# Altium schematic sheet JTAG_Product_Programmer_Interface.SchDoc
size A; Author: Jared Ainsworth; CompanyName: UpRev LLC; Engineer: Jared Ainsworth; Organization: UpRev LLC; Address1: 4807 Commercial Park Dr.; Address2: Austin, TX 78724; Address3: United States; Address4: www.UpRev.com; SheetNumber: 8; SheetTotal: 13
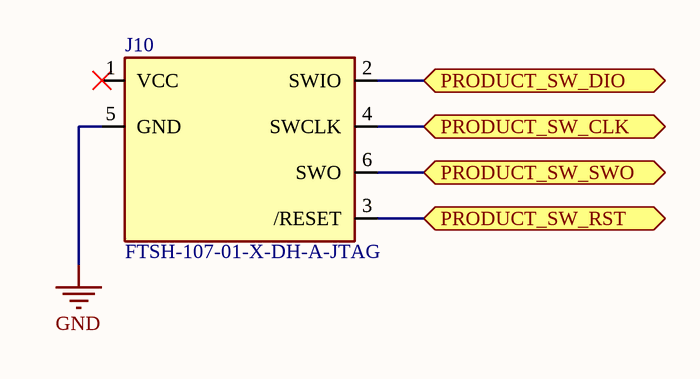
[diagram p0: JTAG_Product_Programmer_Interface.SchDoc]

## Parts
J10  FTSH-107-01-X-DH-A-JTAG  [Connector 14 pos SAMTEC_FTSH-107-01-X-DH-A]

## Ports
PRODUCT_SW_CLK (bidir, see Top_Level[2B], Dev_Board_Connection[3B]), PRODUCT_SW_DIO (bidir, see Top_Level[2B], Dev_Board_Connection[2B]), PRODUCT_SW_RST (bidir, see Top_Level[2B], Dev_Board_Connection[2B]), PRODUCT_SW_SWO (bidir, see Top_Level[2B], Dev_Board_Connection[3B])

## Nets
GND: J10.5(GND)
PRODUCT_SW_CLK: J10.4(SWCLK) ; port PRODUCT_SW_CLK
PRODUCT_SW_DIO: J10.2(SWIO) ; port PRODUCT_SW_DIO
PRODUCT_SW_RST: J10.3(/RESET) ; port PRODUCT_SW_RST
PRODUCT_SW_SWO: J10.6(SWO) ; port PRODUCT_SW_SWO

Not connected (* = marked no-connect by the designer): J10 1(VCC)*

## Notes on the sheet
- Title
- Size:
- Engineer:
- A
- Number:
- Revision:
- Sheet
- of
- File:

## Library data of the parts
J10 = FTSH-107-01-X-DH-A-JTAG: 14 pos High Reliability Header Strips, 0.050in pitch, Right Angle, Alignment Pins; Manufacturer: Samtec; Package: SMD,P=1.27mm,Surface Mount，Right Angle; Manufacturer Part Number: FTSH-107-01-X-DH-A; LCSC Part Number: C21934755